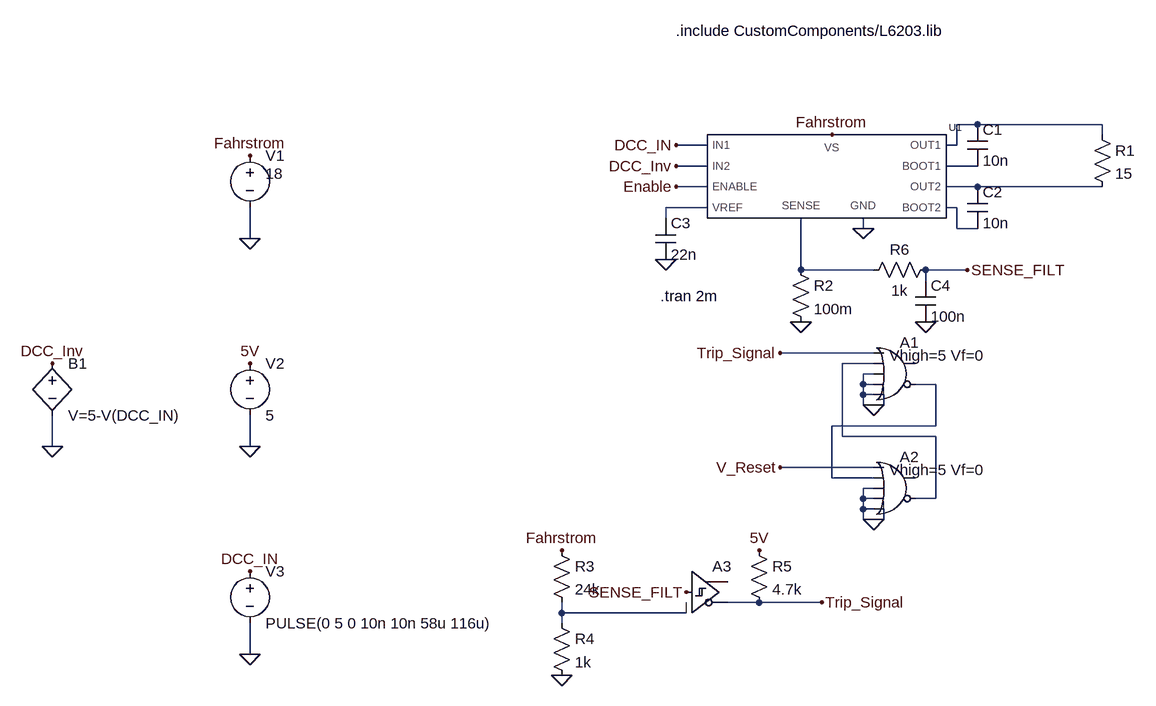
[diagram p0: schematic DCC_Booster_Test_V1.0.asc]
DCC_Booster_Test_V1.0.asc, the LTspice schematic file:
Version 4.1
SHEET 1 880 932
WIRE 432 64 400 64
WIRE 624 64 432 64
WIRE 624 80 624 64
WIRE 16 96 -32 96
WIRE 400 96 400 64
WIRE 400 96 384 96
WIRE 16 128 -32 128
WIRE 432 128 384 128
WIRE 16 160 -32 160
WIRE 432 160 384 160
WIRE 624 160 432 160
WIRE 16 192 -48 192
WIRE 400 192 384 192
WIRE -48 208 -48 192
WIRE 256 224 256 208
WIRE 400 224 400 192
WIRE 432 224 400 224
WIRE -688 240 -688 192
WIRE 160 288 160 208
WIRE 272 288 160 288
WIRE 416 288 352 288
WIRE 352 304 352 288
WIRE 272 416 128 416
WIRE 272 432 224 432
WIRE 272 448 256 448
WIRE 256 464 256 448
WIRE 272 464 256 464
WIRE 368 464 336 464
WIRE 256 480 256 464
WIRE 272 480 256 480
WIRE 256 496 256 480
WIRE 272 496 256 496
WIRE 288 496 288 480
WIRE 288 496 272 496
WIRE 368 528 368 464
WIRE 368 528 208 528
WIRE 224 544 224 432
WIRE 368 544 224 544
WIRE -992 560 -992 512
WIRE -688 560 -688 512
WIRE 272 592 128 592
WIRE 208 608 208 528
WIRE 272 608 208 608
WIRE 272 624 256 624
WIRE 256 640 256 624
WIRE 272 640 256 640
WIRE 368 640 368 544
WIRE 368 640 336 640
WIRE 256 656 256 640
WIRE 272 656 256 656
WIRE 256 672 256 656
WIRE 272 672 256 672
WIRE 288 672 288 656
WIRE 288 672 272 672
WIRE 96 800 48 800
WIRE 192 800 96 800
WIRE -208 816 -208 800
WIRE -16 816 -208 816
WIRE -208 832 -208 816
WIRE -688 880 -688 832
FLAG -688 240 0
FLAG -688 112 Fahrstrom
FLAG -688 560 0
FLAG -688 432 5V
FLAG -688 880 0
FLAG -688 752 DCC_IN
FLAG -992 560 0
FLAG -992 432 DCC_Inv
FLAG 208 80 Fahrstrom
FLAG -32 160 Enable
FLAG -32 96 DCC_IN
FLAG -32 128 DCC_Inv
FLAG 256 224 0
FLAG -48 272 0
FLAG 160 368 0
FLAG 272 496 0
FLAG 272 672 0
FLAG 128 416 Trip_Signal
FLAG 128 592 V_Reset
FLAG 416 288 SENSE_FILT
FLAG -16 784 SENSE_FILT
FLAG -208 912 0
FLAG 192 800 Trip_Signal
FLAG 96 720 5V
FLAG 352 368 0
FLAG -208 720 Fahrstrom
SYMBOL CustomComponents\\L6203 208 176 R0
SYMATTR InstName U1
SYMBOL voltage -688 96 R0
WINDOW 3 24 44 Left 2
WINDOW 123 0 0 Left 0
WINDOW 39 0 0 Left 0
SYMATTR Value 18
SYMATTR InstName V1
SYMBOL voltage -688 416 R0
WINDOW 123 0 0 Left 0
WINDOW 39 0 0 Left 0
SYMATTR InstName V2
SYMATTR Value 5
SYMBOL voltage -688 736 R0
WINDOW 123 0 0 Left 0
WINDOW 39 0 0 Left 0
SYMATTR InstName V3
SYMATTR Value PULSE(0 5 0 10n 10n 58u 116u)
SYMBOL bv -992 416 R0
SYMATTR InstName B1
SYMATTR Value V=5-V(DCC_IN)
SYMBOL cap 416 64 R0
SYMATTR InstName C1
SYMATTR Value 10n
SYMBOL cap 416 160 R0
SYMATTR InstName C2
SYMATTR Value 10n
SYMBOL res 608 64 R0
SYMATTR InstName R1
SYMATTR Value 15
SYMBOL cap -64 208 R0
SYMATTR InstName C3
SYMATTR Value 22n
SYMBOL Digital\\or 304 384 R0
WINDOW 123 -8 36 Left 2
SYMATTR Value2 Vhigh=5 Vf=0
SYMATTR InstName A1
SYMBOL Digital\\or 304 560 R0
WINDOW 123 -8 36 Left 2
SYMATTR Value2 Vhigh=5 Vf=0
SYMATTR InstName A2
SYMBOL Digital\\schmitt -16 720 R0
SYMATTR InstName A3
SYMBOL res 144 272 R0
SYMATTR InstName R2
SYMATTR Value 100m
SYMBOL res -224 704 R0
SYMATTR InstName R3
SYMATTR Value 24k
SYMBOL res -224 816 R0
SYMATTR InstName R4
SYMATTR Value 1k
SYMBOL res 80 704 R0
SYMATTR InstName R5
SYMATTR Value 4.7k
SYMBOL res 368 272 R90
WINDOW 0 0 56 VBottom 2
WINDOW 3 32 56 VTop 2
SYMATTR InstName R6
SYMATTR Value 1k
SYMBOL cap 336 304 R0
SYMATTR InstName C4
SYMATTR Value 100n
TEXT -32 -80 Left 2 !.include CustomComponents/L6203.lib
TEXT -56 328 Left 2 !.tran 2m

The netlist it stands for:
* DCC_Booster_Test_V1.0.asc
X§U1 N003 Fahrstrom N001 N002 DCC_IN 0 DCC_Inv N005 N004 N006 Enable L6203  ; pins OUT2 VS OUT1 BOOT1 IN1 GND IN2 BOOT2 VREF SENSE ENABLE
V1 Fahrstrom 0 18
V2 5V 0 5
V3 DCC_IN 0 PULSE(0 5 0 10n 10n 58u 116u)
B1 DCC_Inv 0 V=5-V(DCC_IN)
C1 N001 N002 10n
C2 N003 N005 10n
R1 N001 N003 15
C3 N004 0 22n
A1 Trip_Signal N007 0 0 0 N008 0 0 OR Vhigh=5 Vf=0
A2 V_Reset N008 0 0 0 N007 0 0 OR Vhigh=5 Vf=0
A3 SENSE_FILT N009 N009 N009 N009 Trip_Signal N009 N009 SCHMITT
R2 N006 0 100m
R3 Fahrstrom N009 24k
R4 N009 0 1k
R5 5V Trip_Signal 4.7k
R6 SENSE_FILT N006 1k
C4 SENSE_FILT 0 100n
.include CustomComponents/L6203.lib
.tran 2m
.backanno
.end